# Altium project Servo-Driver-v2.0.PrjPcb (part 10 of 20)

## Sheet Controller-Driver-Sheet-2.SchDoc
size 420 x 297 mm; SheetNumber: 7; SheetTotal: 15
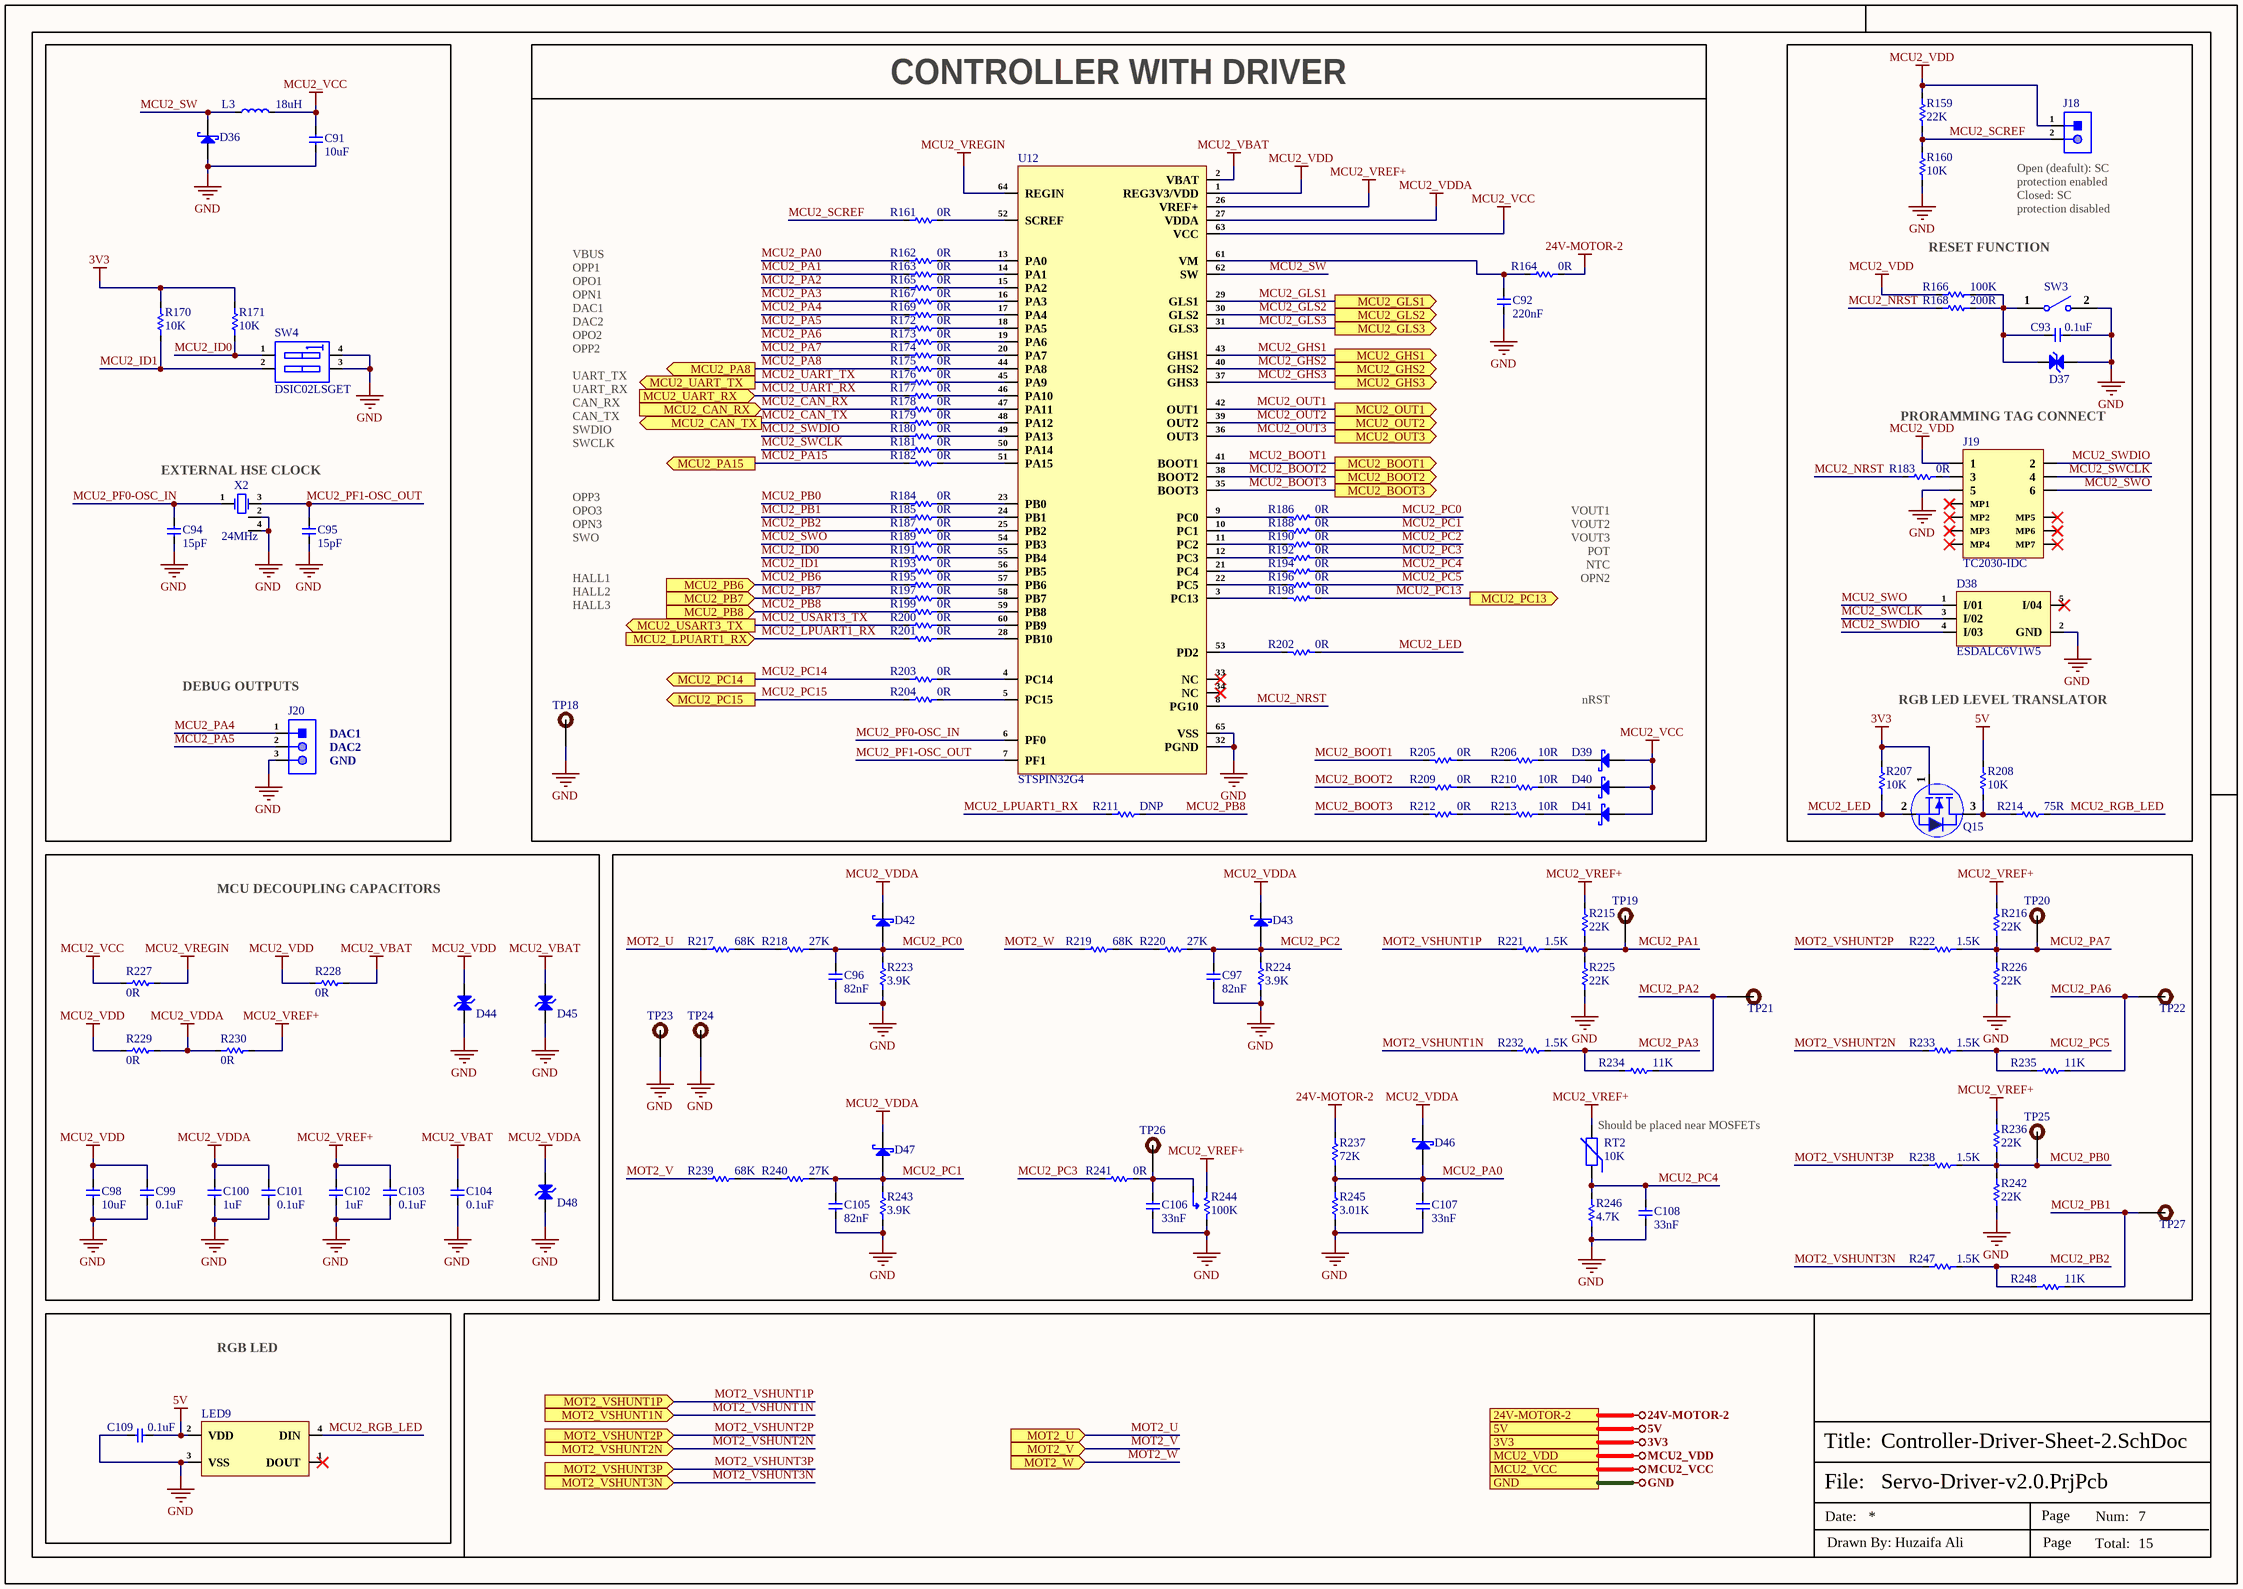
[diagram p8: Controller-Driver-Sheet-2.SchDoc]

### Parts
C91  10uF  [Cap-0805]
C92  220nF  [Cap-0805]
C93  0.1uF  [Cap-0402]
C94  15pF  [Cap-0201]
C95  15pF  [Cap-0201]
C96  82nF  [Cap-0603]
C97  82nF  [Cap-0603]
C98  10uF  [Cap-0603]
C99  0.1uF  [Cap-0402]
C100  1uF  [Cap-0402]
C101  0.1uF  [Cap-0402]
C102  1uF  [Cap-0402]
C103  0.1uF  [Cap-0402]
C104  0.1uF  [Cap-0402]
C105  82nF  [Cap-0603]
C106  33nF  [Cap-0603]
C107  33nF  [Cap-0603]
C108  33nF  [Cap-0603]
C109  0.1uF  [Cap-0402]
D36  STPS1H100A  [SMA]  (value not drawn)
D37  ESDM2033MX4T5G  [DFN-2(0.3x0.6)]  (value not drawn)
D38  ESDALC6V1W5  [SOT-323-5]
D39  BAT46ZFILM  [SOD-123]  (value not drawn)
D40  BAT46ZFILM  [SOD-123]  (value not drawn)
D41  BAT46ZFILM  [SOD-123]  (value not drawn)
D42  BAT30KFILM  [SOD-523]  (value not drawn)
D43  BAT30KFILM  [SOD-523]  (value not drawn)
D44  ESDM2033MX4T5G  [DFN-2(0.3x0.6)]  (value not drawn)
D45  ESDM2033MX4T5G  [DFN-2(0.3x0.6)]  (value not drawn)
D46  BAT30KFILM  [SOD-523]  (value not drawn)
D47  BAT30KFILM  [SOD-523]  (value not drawn)
D48  ESDM2033MX4T5G  [DFN-2(0.3x0.6)]  (value not drawn)
J18  X6511WV-02H-C60D30  [HDR1X2_]  (value not drawn)
J19  TC2030-IDC  [TC2030-IDC_]
J20  X6511WV-03H-C60D30  [HDR1X3_]  (value not drawn)
L3  18uH  [FNR5040S180MT]
LED9  WS2812D-F5  [WS2812D-F5]  (value not drawn)
Q15  Si2302CDS  [Sot-23]  (value not drawn)
R159  22K  [Res-0402]
R160  10K  [Res-0402]
R161  0R  [Res-0402]
R162  0R  [Res-0402]
R163  0R  [Res-0402]
R164  0R  [Res-0805]
R165  0R  [Res-0402]
R166  100K  [Res-0402]
R167  0R  [Res-0402]
R168  200R  [Res-0402]
R169  0R  [Res-0402]
R170  10K  [Res-0402]
R171  10K  [Res-0402]
R172  0R  [Res-0402]
R173  0R  [Res-0402]
R174  0R  [Res-0402]
R175  0R  [Res-0402]
R176  0R  [Res-0402]
R177  0R  [Res-0402]
R178  0R  [Res-0402]
R179  0R  [Res-0402]
R180  0R  [Res-0402]
R181  0R  [Res-0402]
R182  0R  [Res-0402]
R183  0R  [Res-0402]
R184  0R  [Res-0402]
R185  0R  [Res-0402]
R186  0R  [Res-0402]
R187  0R  [Res-0402]
R188  0R  [Res-0402]
R189  0R  [Res-0402]
R190  0R  [Res-0402]
R191  0R  [Res-0402]
R192  0R  [Res-0402]
R193  0R  [Res-0402]
R194  0R  [Res-0402]
R195  0R  [Res-0402]
R196  0R  [Res-0402]
R197  0R  [Res-0402]
R198  0R  [Res-0402]
R199  0R  [Res-0402]
R200  0R  [Res-0402]
R201  0R  [Res-0402]
R202  0R  [Res-0402]
R203  0R  [Res-0402]
R204  0R  [Res-0402]
R205  0R  [Res-0402]
R206  10R  [Res-0603]
R207  10K  [Res-0402]
R208  10K  [Res-0402]
R209  0R  [Res-0402]
R210  10R  [Res-0603]
R211  DNP  [Res-0402]
R212  0R  [Res-0402]
R213  10R  [Res-0603]
R214  75R  [Res-0402]
R215  22K  [Res-0402]
R216  22K  [Res-0402]
R217  68K  [Res-0603]
R218  27K  [Res-0603]
R219  68K  [Res-0603]
R220  27K  [Res-0603]
R221  1.5K  [Res-0402]
R222  1.5K  [Res-0402]
R223  3.9K  [Res-0603]
R224  3.9K  [Res-0603]
R225  22K  [Res-0402]
R226  22K  [Res-0402]
R227  0R  [Res-0805]
R228  0R  [Res-0805]
R229  0R  [Res-0805]
R230  0R  [Res-0805]
R232  1.5K  [Res-0402]
R233  1.5K  [Res-0402]
R234  11K  [Res-0402]
R235  11K  [Res-0402]
R236  22K  [Res-0402]
R237  72K  [Res-0603]
R238  1.5K  [Res-0402]
R239  68K  [Res-0603]
R240  27K  [Res-0603]
R241  0R  [Res-0805]
R242  22K  [Res-0402]
R243  3.9K  [Res-0603]
R244  100K  [3386P-1-104TLF]
R245  3.01K  [Res-0603]
R246  4.7K  [Res-0402]
R247  1.5K  [Res-0402]
R248  11K  [Res-0402]
RT2  10K  [Res-0603]
SW3  B3U-1000P  [B3U-1000P]  (value not drawn)
SW4  DSIC02LSGET  [DSIC02LSGET]
TP18  TEST POINT  [Test-point]  (value not drawn)  (no BOM)
TP19  TEST POINT  [Test-point]  (value not drawn)  (no BOM)
TP20  TEST POINT  [Test-point]  (value not drawn)  (no BOM)
TP21  TEST POINT  [Test-point]  (value not drawn)  (no BOM)
TP22  TEST POINT  [Test-point]  (value not drawn)  (no BOM)
TP23  TEST POINT  [Test-point]  (value not drawn)  (no BOM)
TP24  TEST POINT  [Test-point]  (value not drawn)  (no BOM)
TP25  TEST POINT  [Test-point]  (value not drawn)  (no BOM)
TP26  TEST POINT  [Test-point]  (value not drawn)  (no BOM)
TP27  TEST POINT  [Test-point]  (value not drawn)  (no BOM)
U12  STSPIN32G4  [64-VFQFPN 9X9]
X2  24MHz  [SMD2016-4P]

### Blocks framed on the sheet
CONTROLLER WITH DRIVER: C92 D39-D41 R161-R165 R167 R169 R172-R182 R184-R206 R209-R213 TP18 U12
MCU DECOUPLING CAPACITORS: C98-C104 D44 D45 D48 R227-R230
Should be placed near MOSFETs: C96 C97 C105-C108 D42 D43 D46 D47 R215-R226 R232-R248 RT2 TP19-TP27
RGB LED: C109 LED9

### Ports
3V3, 5V, 24V-MOTOR-2, GND, MCU2_BOOT1 (out), MCU2_BOOT2 (out), MCU2_BOOT3 (out), MCU2_CAN_RX (in), MCU2_CAN_TX (out), MCU2_GHS1 (out), MCU2_GHS2 (out), MCU2_GHS3 (out), MCU2_GLS1 (out), MCU2_GLS2 (out), MCU2_GLS3 (out), MCU2_LPUART1_RX (in), MCU2_OUT1 (out), MCU2_OUT2 (out), MCU2_OUT3 (out), MCU2_PA8 (out), MCU2_PA15 (out), MCU2_PB6 (in), MCU2_PB7 (in), MCU2_PB8 (in), MCU2_PC13 (out), MCU2_PC14 (out), MCU2_PC15 (out), MCU2_UART_RX (in), MCU2_UART_TX (out), MCU2_USART3_TX (out), MCU2_VCC, MCU2_VDD, MOT2_U (in), MOT2_V (in), MOT2_VSHUNT1N (in), MOT2_VSHUNT1P (in), MOT2_VSHUNT2N (in), MOT2_VSHUNT2P (in), MOT2_VSHUNT3N (in), MOT2_VSHUNT3P (in), MOT2_W (in)

### Nets
3V3: Q15.1(G) R170.2 R171.2 R207.2 ; port 3V3
5V: C109.2 LED9.2(VDD) R208.2 ; port 5V
24V-MOTOR-2: R164.2 R237.2 ; port 24V-MOTOR-2
GND: C91.1 C92.1 C93.1 C94.1 C95.1 C96.1 C97.1 C98.1 C99.1 C100.1 C101.1 C102.1 C103.1 C104.1 C105.1 C106.1 C107.1 C108.1 C109.1 D36.2(A) D37.1(A) D38.2(GND) D44.1(A) D45.1(A) D48.1(A) J19.5 J20.3 LED9.3(VSS) R160.1 R223.1 R224.1 R225.1 R226.1 R242.1 R243.1 R244.3(CW) R245.1 R246.1 SW3.2 SW4.3(A3) SW4.4(B3) TP18.1 TP23.1 TP24.1 U12.32(PGND) U12.65(VSS) X2.2(GND) X2.4(GND) ; port GND
MCU2_VBAT: C104.2 D45.2(A) R228.2 U12.2(VBAT)
MCU2_VCC: C91.2 D39.1(A) D40.1(A) D41.1(A) L3.2 R227.1 U12.63(VCC) ; port MCU2_VCC
MCU2_VDD: C98.2 C99.2 D44.2(A) J18.1 J19.1 R159.2 R166.1 R228.1 R229.1 U12.1(REG3V3/VDD) ; port MCU2_VDD
MCU2_VDDA: C100.2 C101.2 D42.2(K) D43.2(K) D46.2(K) D47.2(K) D48.2(A) R229.2 R230.1 U12.27(VDDA)
MCU2_VREF+: C102.2 C103.2 R215.2 R216.2 R230.2 R236.2 R244.1(CCW) RT2.2 U12.26(VREF+)
MCU2_VREGIN: R227.2 U12.64(REGIN)
MCU2_BOOT1: R205.1 U12.41(BOOT1) ; port MCU2_BOOT1
MCU2_BOOT2: R209.1 U12.38(BOOT2) ; port MCU2_BOOT2
MCU2_BOOT3: R212.1 U12.35(BOOT3) ; port MCU2_BOOT3
MCU2_CAN_RX: R178.2 ; port MCU2_CAN_RX
MCU2_CAN_TX: R179.2 ; port MCU2_CAN_TX
MCU2_GHS1: U12.43(GHS1) ; port MCU2_GHS1
MCU2_GHS2: U12.40(GHS2) ; port MCU2_GHS2
MCU2_GHS3: U12.37(GHS3) ; port MCU2_GHS3
MCU2_GLS1: U12.29(GLS1) ; port MCU2_GLS1
MCU2_GLS2: U12.30(GLS2) ; port MCU2_GLS2
MCU2_GLS3: U12.31(GLS3) ; port MCU2_GLS3
MCU2_ID0: R171.1 R191.2 SW4.1(A1)
MCU2_ID1: R170.1 R193.2 SW4.2(A2)
MCU2_LED: Q15.2(S) R202.2 R207.1
MCU2_LPUART1_RX: R201.2 R211.2 ; port MCU2_LPUART1_RX  [project net MCU2_485_ROUT]
MCU2_NRST: R168.1 R183.2 U12.8(PG10)
MCU2_OUT1: U12.42(OUT1) ; port MCU2_OUT1
MCU2_OUT2: U12.39(OUT2) ; port MCU2_OUT2
MCU2_OUT3: U12.36(OUT3) ; port MCU2_OUT3
MCU2_PA0: C107.2 D46.1(A) R162.2 R237.1 R245.2
MCU2_PA1: R163.2 R215.1 R221.2 R225.2 TP19.1
MCU2_PA2: R165.2 R234.2 TP21.1
MCU2_PA3: R167.2 R232.2 R234.1
MCU2_PA4: J20.1 R169.2
MCU2_PA5: J20.2 R172.2
MCU2_PA6: R173.2 R235.2 TP22.1
MCU2_PA7: R174.2 R216.1 R222.2 R226.2 TP20.1
MCU2_PA8: R175.2 ; port MCU2_PA8
MCU2_PA15: R182.2 ; port MCU2_PA15
MCU2_PB0: R184.2 R236.1 R238.2 R242.2 TP25.1
MCU2_PB1: R185.2 R248.2 TP27.1
MCU2_PB2: R187.2 R247.2 R248.1
MCU2_PB6: R195.2 ; port MCU2_PB6  [project net MCU2_HALL1]
MCU2_PB7: R197.2 ; port MCU2_PB7  [project net MCU2_HALL2]
MCU2_PB8: R199.2 R211.1 ; port MCU2_PB8  [project net MCU2_HALL3]
MCU2_PC0: C96.2 D42.1(A) R186.2 R218.2 R223.2
MCU2_PC1: C105.2 D47.1(A) R188.2 R240.2 R243.2
MCU2_PC2: C97.2 D43.1(A) R190.2 R220.2 R224.2
MCU2_PC3: R192.2 R241.1
MCU2_PC4: C108.2 R194.2 R246.2 RT2.1
MCU2_PC5: R196.2 R233.2 R235.1
MCU2_PC13: R198.2 ; port MCU2_PC13  [project net MCU2_DR_RCV_EN]
MCU2_PC14: R203.2 ; port MCU2_PC14  [project net MCU2_CAN_SHDN]
MCU2_PC15: R204.2 ; port MCU2_PC15  [project net MCU2_CAN_STB]
MCU2_PF0-OSC_IN: C94.2 U12.6(PF0) X2.1(OSC1)
MCU2_PF1-OSC_OUT: C95.2 U12.7(PF1) X2.3(OSC2)
MCU2_RGB_LED: LED9.4(DIN) R214.2
MCU2_SCREF: J18.2 R159.1 R160.2 R161.2
MCU2_SW: D36.1(K) L3.1 U12.62(SW)
MCU2_SWCLK: D38.3(I/02) J19.4 R181.2
MCU2_SWDIO: D38.4(I/03) J19.2 R180.2
MCU2_SWO: D38.1(I/01) J19.6 R189.2
MCU2_UART_RX: R177.2 ; port MCU2_UART_RX
MCU2_UART_TX: R176.2 ; port MCU2_UART_TX
MCU2_USART3_TX: R200.2 ; port MCU2_USART3_TX  [project net MCU2_485_DIN]
MOT2_U: R217.1 ; port MOT2_U
MOT2_V: R239.1 ; port MOT2_V
MOT2_VSHUNT1N: R232.1 ; port MOT2_VSHUNT1N
MOT2_VSHUNT1P: R221.1 ; port MOT2_VSHUNT1P
MOT2_VSHUNT2N: R233.1 ; port MOT2_VSHUNT2N
MOT2_VSHUNT2P: R222.1 ; port MOT2_VSHUNT2P
MOT2_VSHUNT3N: R247.1 ; port MOT2_VSHUNT3N
MOT2_VSHUNT3P: R238.1 ; port MOT2_VSHUNT3P
MOT2_W: R219.1 ; port MOT2_W
NetC92_2: C92.2 R164.1 U12.61(VM)
NetC93_2: C93.2 D37.2(A) R166.2 R168.2 SW3.1
NetC106_2: C106.2 R241.2 R244.2(Wiper) TP26.1
NetD39_2: D39.2(K) R206.2
NetD40_2: D40.2(K) R210.2
NetD41_2: D41.2(K) R213.2
NetJ19_3: J19.3 R183.1
NetQ15_3: Q15.3(D) R208.1 R214.1
NetR161_1: R161.1 U12.52(SCREF)
NetR162_1: R162.1 U12.13(PA0)
NetR163_1: R163.1 U12.14(PA1)
NetR165_1: R165.1 U12.15(PA2)
NetR167_1: R167.1 U12.16(PA3)
NetR169_1: R169.1 U12.17(PA4)
NetR172_1: R172.1 U12.18(PA5)
NetR173_1: R173.1 U12.19(PA6)
NetR174_1: R174.1 U12.20(PA7)
NetR175_1: R175.1 U12.44(PA8)
NetR176_1: R176.1 U12.45(PA9)
NetR177_1: R177.1 U12.46(PA10)
NetR178_1: R178.1 U12.47(PA11)
NetR179_1: R179.1 U12.48(PA12)
NetR180_1: R180.1 U12.49(PA13)
NetR181_1: R181.1 U12.50(PA14)
NetR182_1: R182.1 U12.51(PA15)
NetR184_1: R184.1 U12.23(PB0)
NetR185_1: R185.1 U12.24(PB1)
NetR186_1: R186.1 U12.9(PC0)
NetR187_1: R187.1 U12.25(PB2)
NetR188_1: R188.1 U12.10(PC1)
NetR189_1: R189.1 U12.54(PB3)
NetR190_1: R190.1 U12.11(PC2)
NetR191_1: R191.1 U12.55(PB4)
NetR192_1: R192.1 U12.12(PC3)
NetR193_1: R193.1 U12.56(PB5)
NetR194_1: R194.1 U12.21(PC4)
NetR195_1: R195.1 U12.57(PB6)
NetR196_1: R196.1 U12.22(PC5)
NetR197_1: R197.1 U12.58(PB7)
NetR198_1: R198.1 U12.3(PC13)
NetR199_1: R199.1 U12.59(PB8)
NetR200_1: R200.1 U12.60(PB9)
NetR201_1: R201.1 U12.28(PB10)
NetR202_1: R202.1 U12.53(PD2)
NetR203_1: R203.1 U12.4(PC14)
NetR204_1: R204.1 U12.5(PC15)
NetR205_2: R205.2 R206.1
NetR209_2: R209.2 R210.1
NetR212_2: R212.2 R213.1
NetR217_2: R217.2 R218.1
NetR219_2: R219.2 R220.1
NetR239_2: R239.2 R240.1

Not connected (* = marked no-connect by the designer): D38 5(I/04)*; J19 MP1* MP2* MP3* MP4* MP5* MP6* MP7*; LED9 1(DOUT)*; U12 33(NC)* 34(NC)*

### Notes on the sheet
- VBUS
- OPP1
- RESET FUNCTION
- (near J18) Open (deafult): SC protection enabled
  Closed: SC protection disabled
- OPO1
- OPN1
- DAC1
- DAC2
- OPO2
- OPP2
- UART_TX
- UART_RX
- CAN_RX
- CAN_TX
- SWDIO
- SWCLK
- PRORAMMING TAG CONNECT
- (near X2) EXTERNAL HSE CLOCK
- OPP3
- OPO3
- OPN3
- SWO
- VOUT1
- VOUT2
- VOUT3
- HALL1
- HALL2
- POT
- NTC
- OPN2
- HALL3
- (near J20) DEBUG OUTPUTS
- (near J20) DAC1
- nRST
- RGB LED LEVEL TRANSLATOR
- (near J20) DAC2
- (near J20) GND
- File:
- Title:
- Date:
- Page
- Num:
- Total:
- Drawn By: Huzaifa Ali